# Altium schematic sheet ESP32_Board.SchDoc
size A4; SheetNumber: 4; SheetTotal: 7
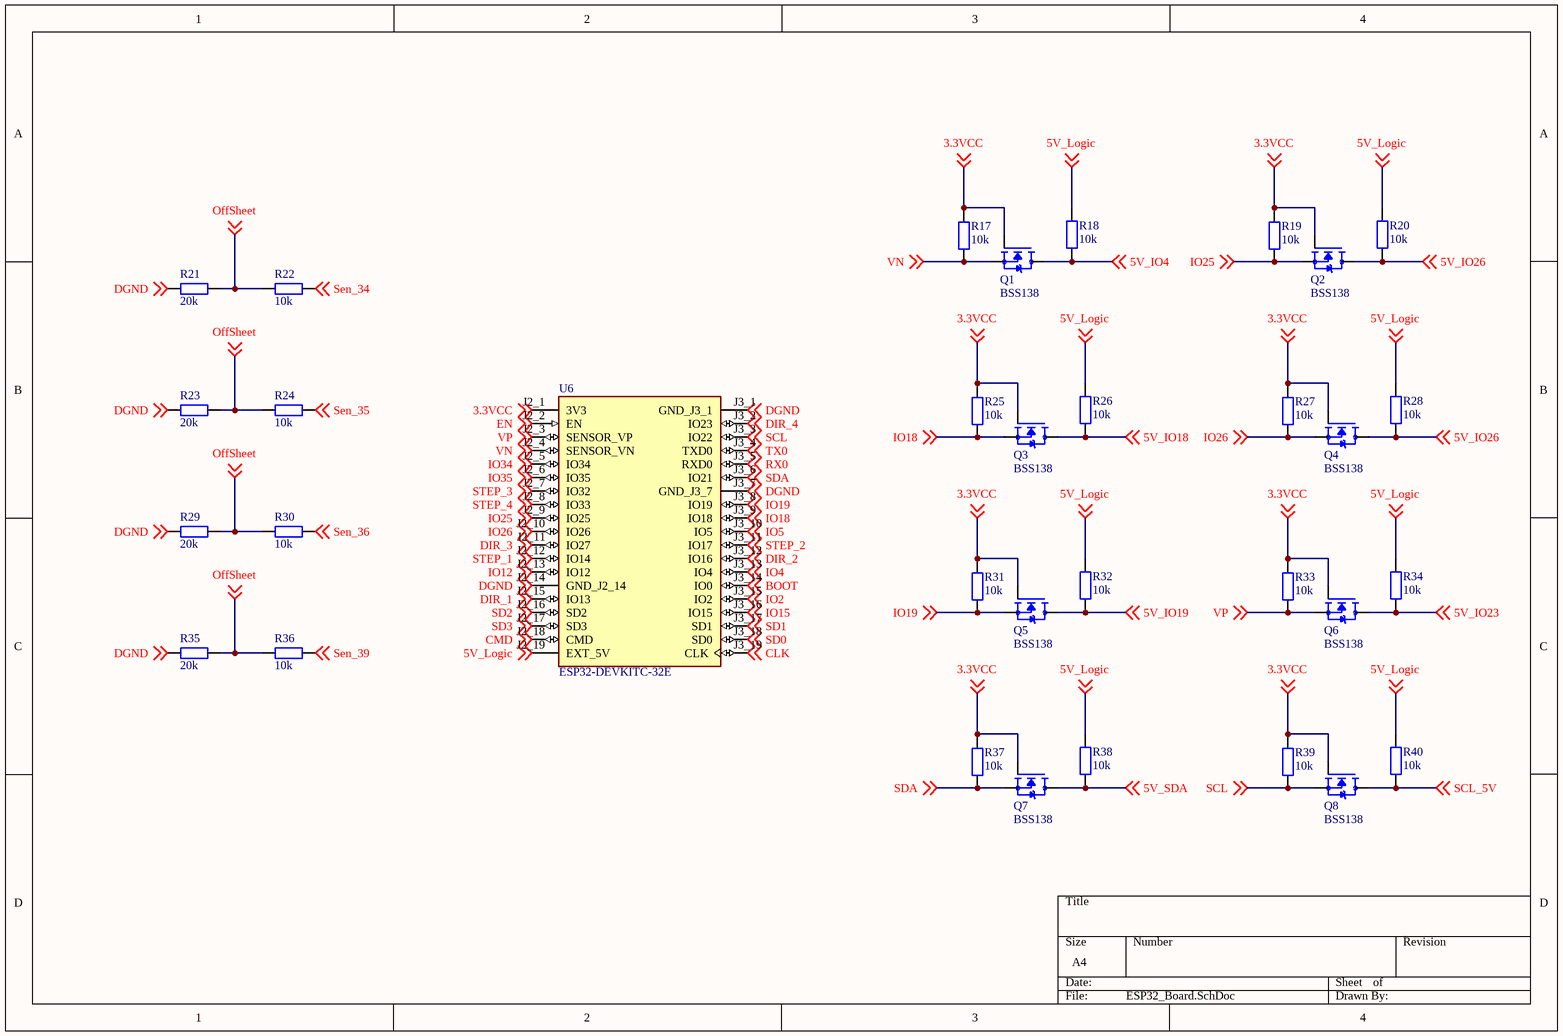
[diagram p0: ESP32_Board.SchDoc]

## Parts
Q1  BSS138  [SOT95P240X111-3N]
Q2  BSS138  [SOT95P240X111-3N]
Q3  BSS138  [SOT95P240X111-3N]
Q4  BSS138  [SOT95P240X111-3N]
Q5  BSS138  [SOT95P240X111-3N]
Q6  BSS138  [SOT95P240X111-3N]
Q7  BSS138  [SOT95P240X111-3N]
Q8  BSS138  [SOT95P240X111-3N]
R17  10k  [tro smd 0805]
R18  10k  [tro smd 0805]
R19  10k  [tro smd 0805]
R20  10k  [tro smd 0805]
R21  20k  [tro smd 0805]
R22  10k  [tro smd 0805]
R23  20k  [tro smd 0805]
R24  10k  [tro smd 0805]
R25  10k  [tro smd 0805]
R26  10k  [tro smd 0805]
R27  10k  [tro smd 0805]
R28  10k  [tro smd 0805]
R29  20k  [tro smd 0805]
R30  10k  [tro smd 0805]
R31  10k  [tro smd 0805]
R32  10k  [tro smd 0805]
R33  10k  [tro smd 0805]
R34  10k  [tro smd 0805]
R35  20k  [tro smd 0805]
R36  10k  [tro smd 0805]
R37  10k  [tro smd 0805]
R38  10k  [tro smd 0805]
R39  10k  [tro smd 0805]
R40  10k  [tro smd 0805]
U6  ESP32-DEVKITC-32E  [MODULE_ESP32-DEVKITC-32E]

## Nets
3.3VCC: Q1.1(G) Q2.1(G) Q3.1(G) Q4.1(G) Q5.1(G) Q6.1(G) Q7.1(G) Q8.1(G) R17.1 R19.1 R25.1 R27.1 R31.1 R33.1 R37.1 R39.1 U6.J2_1(3V3) ; off-sheet 3.3VCC
5V_IO4: Q1.3(D) R18.2 ; off-sheet 5V_IO4
5V_IO18: Q3.3(D) R26.2 ; off-sheet 5V_IO18
5V_IO19: Q5.3(D) R32.2 ; off-sheet 5V_IO19
5V_IO23: Q6.3(D) R34.2 ; off-sheet 5V_IO23
5V_IO26: Q2.3(D) Q4.3(D) R20.2 R28.2 ; off-sheet 5V_IO26
5V_Logic: R18.1 R20.1 R26.1 R28.1 R32.1 R34.1 R38.1 R40.1 U6.J2_19(EXT_5V) ; off-sheet 5V_Logic
5V_SDA: Q7.3(D) R38.2 ; off-sheet 5V_SDA
BOOT: U6.J3_14(IO0) ; off-sheet BOOT
CLK: U6.J3_19(CLK) ; off-sheet CLK
CMD: U6.J2_18(CMD) ; off-sheet CMD
DGND: R21.1 R23.1 R29.1 R35.1 U6.J2_14(GND_J2_14) U6.J3_1(GND_J3_1) U6.J3_7(GND_J3_7) ; off-sheet DGND
DIR_1: U6.J2_15(IO13) ; off-sheet DIR_1
DIR_2: U6.J3_12(IO16) ; off-sheet DIR_2
DIR_3: U6.J2_11(IO27) ; off-sheet DIR_3
DIR_4: U6.J3_2(IO23) ; off-sheet DIR_4
EN: U6.J2_2(EN) ; off-sheet EN
IO2: U6.J3_15(IO2) ; off-sheet IO2
IO4: U6.J3_13(IO4) ; off-sheet IO4
IO5: U6.J3_10(IO5) ; off-sheet IO5
IO12: U6.J2_13(IO12) ; off-sheet IO12
IO15: U6.J3_16(IO15) ; off-sheet IO15
IO18: Q3.2(S) R25.2 U6.J3_9(IO18) ; off-sheet IO18
IO19: Q5.2(S) R31.2 U6.J3_8(IO19) ; off-sheet IO19
IO25: Q2.2(S) R19.2 U6.J2_9(IO25) ; off-sheet IO25
IO26: Q4.2(S) R27.2 U6.J2_10(IO26) ; off-sheet IO26
IO34: U6.J2_5(IO34) ; off-sheet IO34
IO35: U6.J2_6(IO35) ; off-sheet IO35
OffSheet: R21.2 R22.1 R23.2 R24.1 R29.2 R30.1 R35.2 R36.1 ; off-sheet OffSheet
RX0: U6.J3_5(RXD0) ; off-sheet RX0
SCL: Q8.2(S) R39.2 U6.J3_3(IO22) ; off-sheet SCL
SCL_5V: Q8.3(D) R40.2 ; off-sheet SCL_5V
SD0: U6.J3_18(SD0) ; off-sheet SD0
SD1: U6.J3_17(SD1) ; off-sheet SD1
SD2: U6.J2_16(SD2) ; off-sheet SD2
SD3: U6.J2_17(SD3) ; off-sheet SD3
SDA: Q7.2(S) R37.2 U6.J3_6(IO21) ; off-sheet SDA
Sen_34: R22.2 ; off-sheet Sen_34
Sen_35: R24.2 ; off-sheet Sen_35
Sen_36: R30.2 ; off-sheet Sen_36
Sen_39: R36.2 ; off-sheet Sen_39
STEP_1: U6.J2_12(IO14) ; off-sheet STEP_1
STEP_2: U6.J3_11(IO17) ; off-sheet STEP_2
STEP_3: U6.J2_7(IO32) ; off-sheet STEP_3
STEP_4: U6.J2_8(IO33) ; off-sheet STEP_4
TX0: U6.J3_4(TXD0) ; off-sheet TX0
VN: Q1.2(S) R17.2 U6.J2_4(SENSOR_VN) ; off-sheet VN
VP: Q6.2(S) R33.2 U6.J2_3(SENSOR_VP) ; off-sheet VP

## Library data of the parts
Q1-Q8 = BSS138: N-Channel 50 V 220mA (Ta) 350mW (Ta) Surface Mount SOT-23-3; MF: onsemi; SnapEDA_Link: https://www.snapeda.com/parts/BSS138/Onsemi/view-part/?ref=snap; Package: SOT-23-3 ON Semiconductor; Value: *; MP: BSS138; Check_prices: https://www.snapeda.com/parts/BSS138/Onsemi/view-part/?ref=eda
R17-R20 R22 R24-R28 R30-R34 R36-R40 = Tro 0805 1% 10k: Dán; Don_Vi: Con; So_Chan: 2; Ten_Linh_Kien: Trở 0805 1% 10k; Ma_Hang: MH005473; Chung_Loai: Dán; Kieu_Chan: *
R21 R23 R29 R35 = Tro 0805 5% 20k: Dán; Don_Vi: Con; So_Chan: 2; Ten_Linh_Kien: Trở 0805 5% 20k; Ma_Hang: MH005247; Chung_Loai: Dán; Kieu_Chan: *
U6 = ESP32-DEVKITC-32E: The ESP32-DEVKITC-32E transceiver evaluation board from Espressif Systems is a powerful development tool for wireless communication technologies. It supports 802.11 b/g/n Wi-Fi and BluetoothÂ® Smart Ready 4.x (BLE) dual-mode at 2.4GHz, making it ideal for; SnapEDA_Link: https://www.snapeda.com/parts/ESP32-DEVKITC-32E/Espressif+Systems/view-part/?ref=snap; Package: None; Value: *; MF: Espressif Systems; MP: ESP32-DEVKITC-32E; Check_prices: https://www.snapeda.com/parts/ESP32-DEVKITC-32E/Espressif+Systems/view-part/?ref=eda